# EAGLE design board (EAGLE 9.7.0)
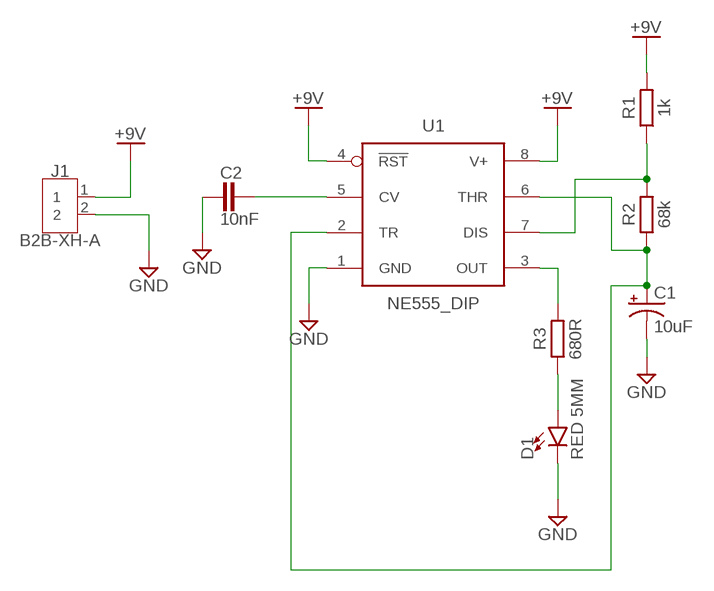
[diagram p0: schematic, sheet 1]

## Parts
C1  10uF  10UF-POLAR-RADIAL-2.5MM-25V-20%  [CPOL-RADIAL-2.5MM-5MM]
C2  10nF  CAPACITORCERAMIC-2.54MM  [CAP-THRU-2.54MM]
D1  RED 5MM  LED5MM  [LED_5MM]
J1  B2B-XH-A  [B2B-XH-A]
R1  1k  RESISTOR_AXIAL-10.16MM-PITCH  [RESAD1016W63L850D250B]
R2  68k  RESISTOR_AXIAL-10.16MM-PITCH  [RESAD1016W63L850D250B]
R3  680R  RESISTOR_AXIAL-10.16MM-PITCH  [RESAD1016W63L850D250B]
U1  NE555_DIP  [DIP826W53P254L959H508Q8B]

## Nets
+9V: J1.1 R1.2 U1.4(!RST) U1.8(V+)
CV: C2.1 U1.5(CV)
DIS: R1.1 R2.2 U1.7(DIS)
GND: C1.2(-) C2.2 D1.K(C) J1.2 U1.1(GND)
LED_A: D1.A R3.1
OUT: R3.2 U1.3(OUT)
THR: C1.1(+) R2.1 U1.2(TR) U1.6(THR)

## Library data of the parts
C1 = SparkFun-Capacitors:10UF-POLAR: 10.0µF polarized capacitors A capacitor is a passive two-terminal electrical component used to store electrical energy temporarily in an electric field.; PROD_ID: CAP-08440
C2 = Tinkercad:CAPACITOR: Capacitor - Generic
D1 = SparkFun-LED:LED: LED (Generic) Standard schematic elements and footprints for 5mm, 3mm, 1206, and 0603 sized LEDs. Generic LEDs with no color specified.
J1 = Connector:B2B-XH-A: XH Connector Top Entry - 2POS Details see: Datasheet <http://www.jst-mfg.com/product/pdf/eng/eXH.pdf>; CATEGORY: Header; DESCRIPTION: Connector Header Through Hole 2 position 0.098" (2.50mm); MANUFACTURER: JST Sales America Inc.; MPN: B2B-XH-A(LF)(SN); OPERATING_TEMPERATURE: -25°C ~ 85°C; PART_STATUS: ACTIVE; PITCH: 0.098" (2.50mm); ROHS_COMPLIANCE: ROHS3 Compliant; SERIES: XH; SUB_CATEGORY: Rectangular Connectors; TYPE: Header, Male Pin, Board to Cable/Wire, Through Hole
R1-R3 = Tinkercad:RESISTOR: Resistor Fixed - Generic
U1 = IC_Clock-Timing:*555: TIMER 555 General purpose precision timers NE555 : Texas Datasheet <http://www.ti.com/general/docs/suppproductinfo.tsp?distId=10&gotoUrl=http%3A%2F%2Fwww.ti.com%2Flit%2Fgpn%2Fne555>, Diodes Incorporated Datasheet <https://www.diodes.com/assets/Datasheets/NE555_SA555_NA555.pdf> LM555 Datasheet <http://www.ti.com/general/docs/suppproductinfo.tsp?distId=10&gotoUrl=http%3A%2F%2Fwww.ti.com%2Flit%2Fgpn%2Flm555> LMC555 Datasheet <http://www.ti.com/general/docs/suppproductinfo.tsp?distId=10&gotoUrl=http%3A%2F%2Fwww.ti.com%2Flit%2Fgpn%2Flmc555> ICM7555 : Maxim Integrated Datasheet <https://datasheets.maximintegrated.com/en/ds/ICM7555-ICM7556.pdf>, Renesas Electronics America Inc Datasheet <https://www.renesas.com/en-us/www/doc/datasheet/icm7555-56.pdf>; CATEGORY: IC_Clock-Timing; CURRENT-SUPPLY: 10mA; DESCRIPTION: IC OSC SINGLE TIMER 100KHZ 8-DIP; FREQUENCY: 100kHz; MANUFACTURER: Texas Instruments; MPN: NE555P; OPERATING_TEMP: 0°C to 70°C; PART_STATUS: Active; ROHS_COMPLIANT: ROHS3 Compliant; SUB-CATEGORY: Timer

## Board
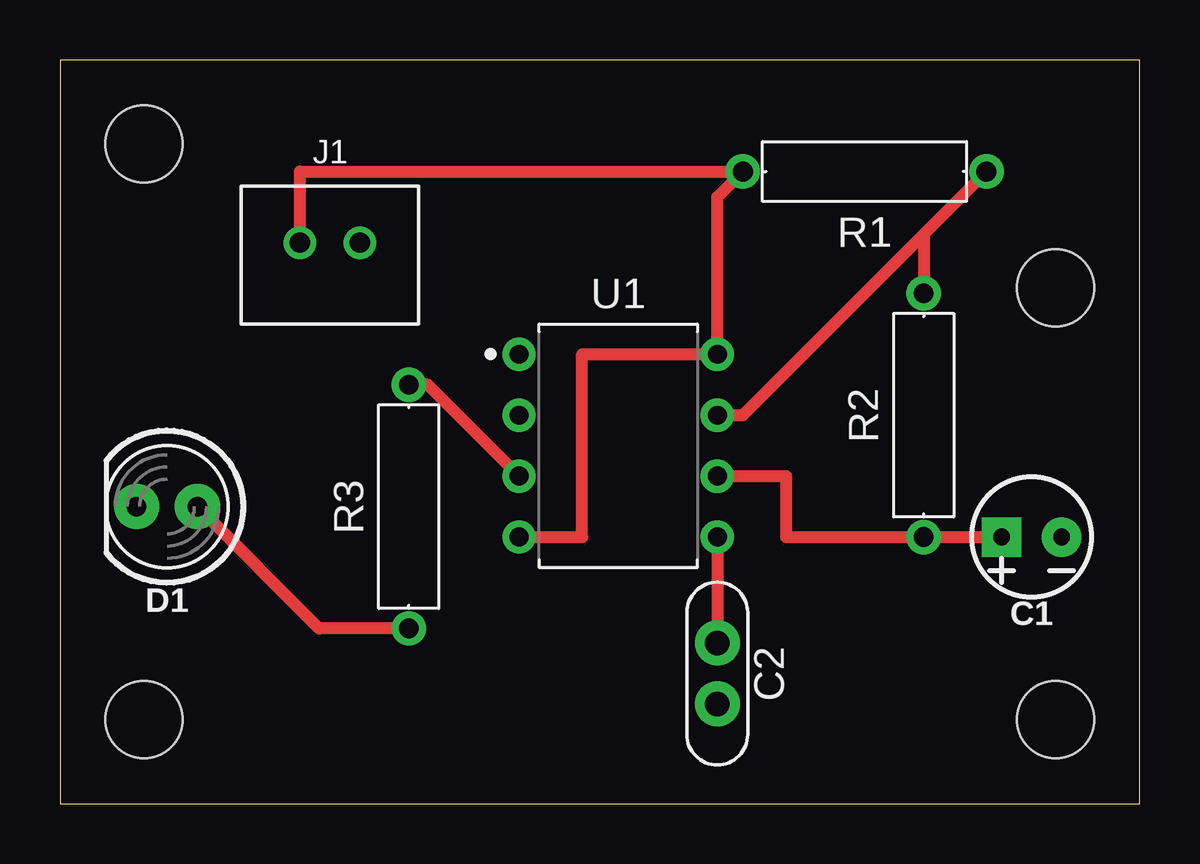
[diagram p1: board, top side]
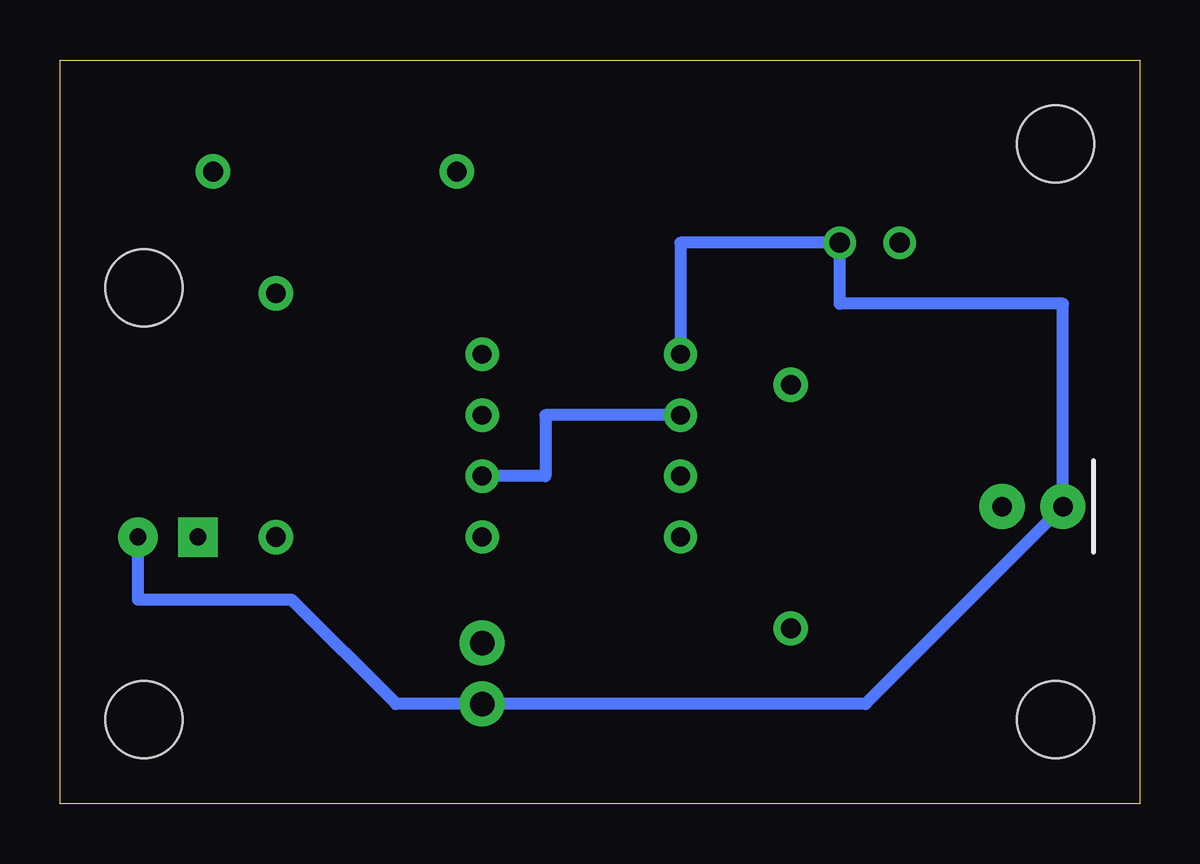
[diagram p2: board, bottom side, seen from below]

Size 45 x 31 mm. Coordinates in mm from the lower left corner, seen from the top.
Outline: 0,0 45,0 45,31 0,31 0,0
Copper layers (1*16): Top 0.035mm / dielectric 1.5mm / Bottom 0.035mm
Design rules "Fusion Electronics Design Rules": minimum track width 6mil, minimum drill 0.35mm, track to track 6mil, track to pad 6mil, pad to pad 6mil, via to via 6mil, smd to smd 6mil, copper to edge 40mil, drill to drill 6mil, minimum pad ring 10mil, minimum via ring 8mil, stop-mask expansion 4mil, vias tented up to drill 32mil, thermal gap 10mil
Holes 3.2 mm at 3.5,3.5 41.5,3.5 3.5,27.5 41.5,21.5

### Footprints (pad centres in the part's own frame; a part is rotated, then mirrored left to right if it is on the bottom)
CPOL-RADIAL-2.5MM-5MM = drill 0.7 pad 1.651 square: 1 1.25,0 | drill 0.7 pad 1.651: 2 -1.25,0
CAP-THRU-2.54MM = drill 1.016 pad 1.88: 1 -1.27,0; 2 1.27,0
LED_5MM = drill 0.813 pad 1.88: A -1.27,0; K 1.27,0
B2B-XH-A = drill 0.84: 1 0,0; 2 2.5,0
RESAD1016W63L850D250B = drill 0.83 pad 1.43: 1 -5.08,0; 2 5.08,0
DIP826W53P254L959H508Q8B = drill 0.786 pad 1.386: 1 -4.13,3.81; 2 -4.13,1.27; 3 -4.13,-1.27; 4 -4.13,-3.81; 5 4.13,-3.81; 6 4.13,-1.27; 7 4.13,1.27; 8 4.13,3.81

### Placement (x,y rotation side)
C1  40.5,11.11 180 top
C2  27.4,5.42 270 top
D1  4.46,12.38 180 top
J1  10,23.38 0 top
R1  33.54,26.35 180 top
R2  36,16.19 90 top
R3  14.54,12.38 90 top
U1  23.27,14.92 0 top

### Tracks (layer width: path | path; a pad name or v marks a point on that pad's centre or on a via)
+9V
  Top 0.5: J1.1 10,26.35 R1.2 27.4,25.29 U1.8 21.77,18.73 21.77,11.11 U1.4
CV
  Top 0.5: U1.5 C2.1
DIS
  Top 0.5: U1.7 28.46,16.19 36,23.73 | R1.1 36,23.73 | 36,23.73 R2.2
GND
  Bottom 0.5: C1.2 41.75,8.5 35.35,8.5 31,4.15 C2.2 11.42,4.15 D1.K 3.19,20.84 12.5,20.84 J1.2 19.14,23.38 U1.1
LED_A
  Top 0.5: R3.1 10.81,7.3 D1.A
OUT
  Top 0.5: U1.3 15.33,17.46 R3.2
THR
  Top 0.5: U1.6 30.27,13.65 30.27,11.11 R2.1 C1.1
  Bottom 0.5: U1.2 24.77,16.19 24.77,13.65 U1.6